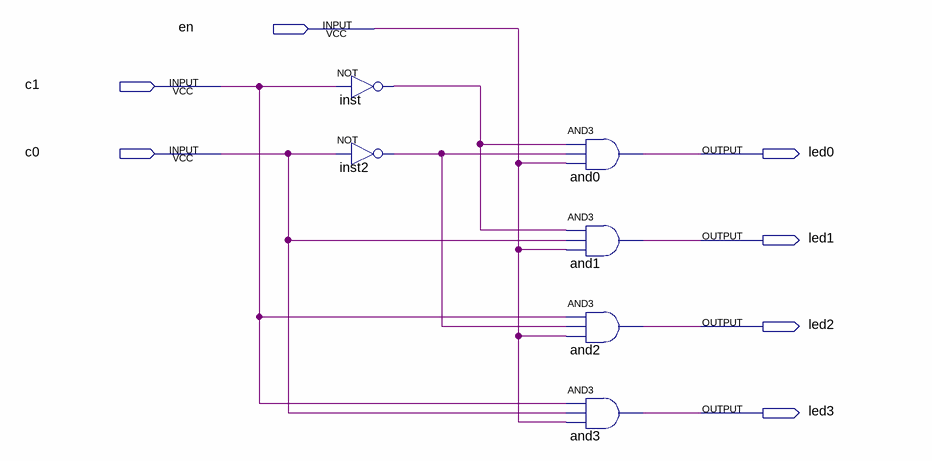
[diagram p0: schematic sheet]
// Quartus schematic mux.bdf as structural Verilog: 6 symbols, 7 pins
module mux (
  input  en,
  input  c1,
  input  c0,
  output led0,
  output led1,
  output led2,
  output led3
);

  wire inst2_out, inst_out;

  not inst (inst_out, c1);
  not inst2 (inst2_out, c0);
  and and0 (led0, inst_out, inst2_out, en);
  and and1 (led1, inst_out, c0, en);
  and and2 (led2, c1, inst2_out, en);
  and and3 (led3, c1, c0, en);
endmodule
